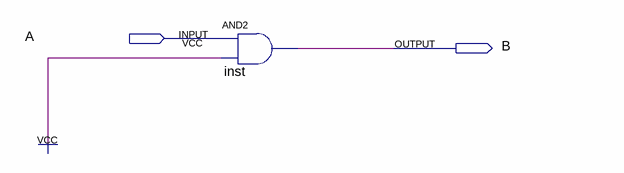
[diagram p0: schematic sheet]
// Quartus schematic adapter.bdf as structural Verilog: 1 symbols, 2 pins
module adapter (
  input  A,
  output B
);

  and inst (B, A, 1'b1);
endmodule
